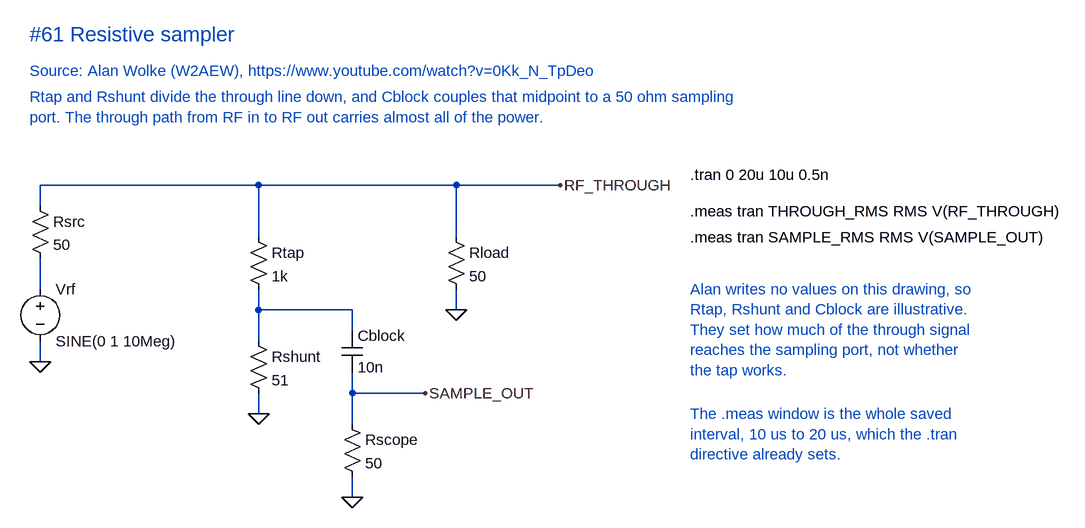
[diagram p0: schematic Resistive sampler.asc]
Resistive sampler.asc, the LTspice schematic file:
Version 4
SHEET 1 1280 820
WIRE -240 32 -240 0
WIRE -240 160 -240 112
WIRE -240 272 -240 240
WIRE 96 0 -240 0
WIRE 400 0 96 0
WIRE 560 0 400 0
WIRE 96 80 96 0
WIRE 96 192 96 160
WIRE 96 240 96 192
WIRE 96 352 96 320
WIRE 240 192 96 192
WIRE 240 224 240 192
WIRE 240 320 240 288
WIRE 240 368 240 320
WIRE 240 480 240 448
WIRE 352 320 240 320
WIRE 400 80 400 0
WIRE 400 192 400 160
FLAG -240 272 0
FLAG 96 352 0
FLAG 240 480 0
FLAG 400 192 0
FLAG 560 0 RF_THROUGH
FLAG 352 320 SAMPLE_OUT
SYMBOL res -256 16 R0
SYMATTR InstName Rsrc
SYMATTR Value 50
SYMBOL voltage -240 144 R0
WINDOW 123 0 0 Left 0
WINDOW 39 0 0 Left 0
SYMATTR InstName Vrf
SYMATTR Value SINE(0 1 10Meg)
SYMBOL res 80 64 R0
SYMATTR InstName Rtap
SYMATTR Value 1k
SYMBOL res 80 224 R0
SYMATTR InstName Rshunt
SYMATTR Value 51
SYMBOL cap 224 224 R0
SYMATTR InstName Cblock
SYMATTR Value 10n
SYMBOL res 224 352 R0
SYMATTR InstName Rscope
SYMATTR Value 50
SYMBOL res 384 64 R0
SYMATTR InstName Rload
SYMATTR Value 50
TEXT -256 -232 Left 3 ;#61 Resistive sampler
TEXT -256 -176 Left 2 ;Source: Alan Wolke (W2AEW), https://www.youtube.com/watch?v=0Kk_N_TpDeo
TEXT -256 -136 Left 2 ;Rtap and Rshunt divide the through line down, and Cblock couples that midpoint to a 50 ohm sampling\nport. The through path from RF in to RF out carries almost all of the power.
TEXT 760 -16 Left 2 !.tran 0 20u 10u 0.5n
TEXT 760 40 Left 2 !.meas tran THROUGH_RMS RMS V(RF_THROUGH)
TEXT 760 80 Left 2 !.meas tran SAMPLE_RMS RMS V(SAMPLE_OUT)
TEXT 760 160 Left 2 ;Alan writes no values on this drawing, so\nRtap, Rshunt and Cblock are illustrative.\nThey set how much of the through signal\nreaches the sampling port, not whether\nthe tap works.
TEXT 760 352 Left 2 ;The .meas window is the whole saved\ninterval, 10 us to 20 us, which the .tran\ndirective already sets.

The netlist it stands for:
* Resistive sampler.asc
Rsrc RF_THROUGH N001 50
Vrf N001 0 SINE(0 1 10Meg)
Rtap RF_THROUGH N002 1k
Rshunt N002 0 51
Cblock N002 SAMPLE_OUT 10n
Rscope SAMPLE_OUT 0 50
Rload RF_THROUGH 0 50
* #61 Resistive sampler
* Source: Alan Wolke (W2AEW), https://www.youtube.com/watch?v=0Kk_N_TpDeo
* Rtap and Rshunt divide the through line down, and Cblock couples that midpoint to a 50 ohm sampling
* port. The through path from RF in to RF out carries almost all of the power.
.tran 0 20u 10u 0.5n
.meas tran THROUGH_RMS RMS V(RF_THROUGH)
.meas tran SAMPLE_RMS RMS V(SAMPLE_OUT)
* Alan writes no values on this drawing, so
* Rtap, Rshunt and Cblock are illustrative.
* They set how much of the through signal
* reaches the sampling port, not whether
* the tap works.
* The .meas window is the whole saved
* interval, 10 us to 20 us, which the .tran
* directive already sets.
.backanno
.end